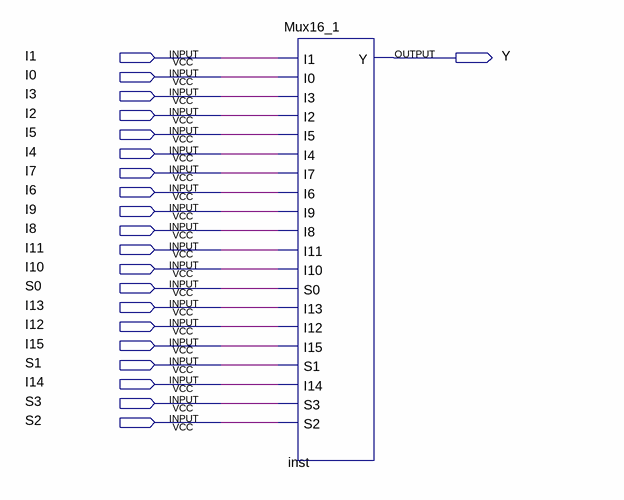
[diagram p0: schematic sheet]
// Quartus schematic MuxDemo2.bdf as structural Verilog: 1 symbols, 21 pins
module MuxDemo2 (
  input  I1,
  input  I0,
  input  I3,
  input  I2,
  input  I5,
  input  I4,
  input  I7,
  input  I6,
  input  I9,
  input  I8,
  input  I11,
  input  I10,
  input  S0,
  input  I13,
  input  I12,
  input  I15,
  input  S1,
  input  I14,
  input  S3,
  input  S2,
  output Y
);

  Mux16_1 inst (
    .I1(I1), .I0(I0), .I3(I3), .I2(I2), .I5(I5), .I4(I4), .I7(I7), .I6(I6), .I9(I9), .I8(I8), .I11(I11),
    .I10(I10), .S0(S0), .I13(I13), .I12(I12), .I15(I15), .S1(S1), .I14(I14), .S3(S3), .S2(S2), .Y(Y));
endmodule
